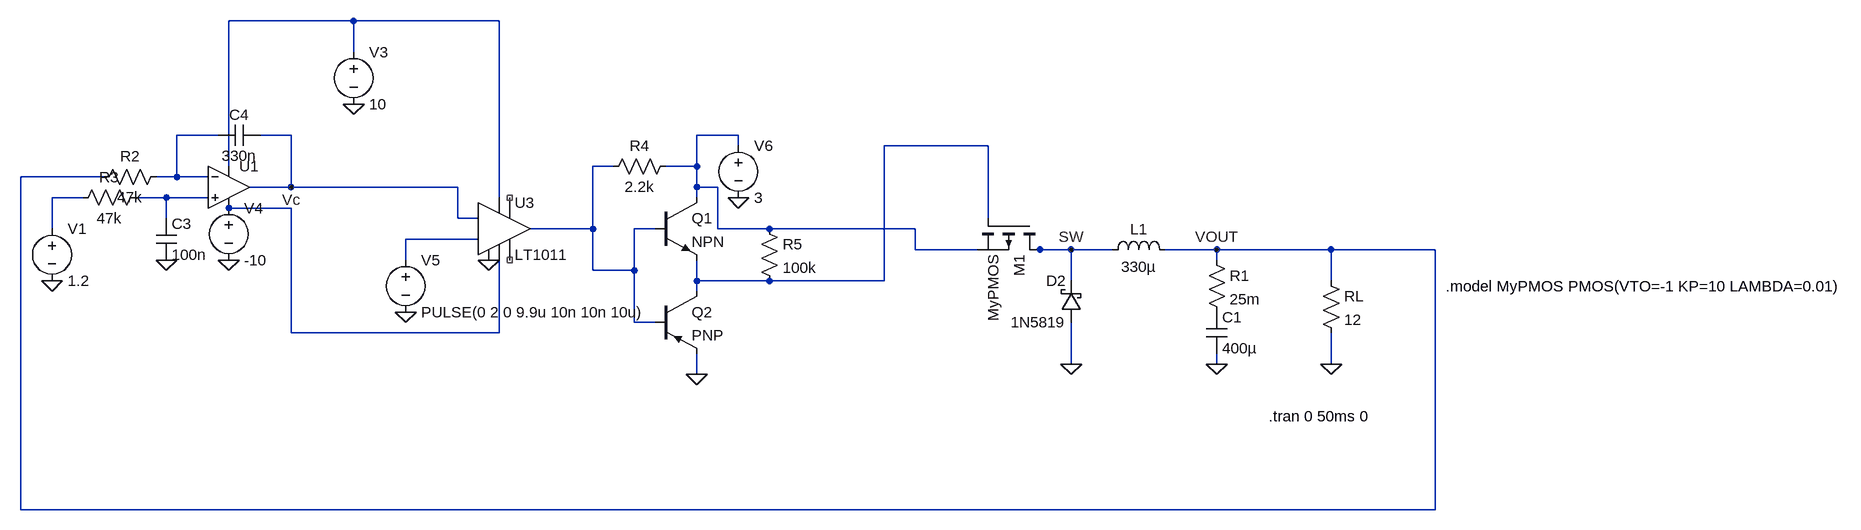
[diagram p0: schematic finalproj.asc]
finalproj.asc, the LTspice schematic file:
Version 4
SHEET 1 1500 680
WIRE -816 -288 -1008 -288
WIRE -592 -288 -816 -288
WIRE -816 -240 -816 -288
WIRE -1024 -112 -1088 -112
WIRE -912 -112 -960 -112
WIRE -224 -112 -288 -112
WIRE -224 -96 -224 -112
WIRE 160 -96 0 -96
WIRE -1008 -64 -1008 -288
WIRE -416 -64 -448 -64
WIRE -288 -64 -288 -112
WIRE -288 -64 -336 -64
WIRE -1200 -48 -1328 -48
WIRE -1088 -48 -1088 -112
WIRE -1088 -48 -1120 -48
WIRE -1040 -48 -1088 -48
WIRE -912 -32 -912 -112
WIRE -912 -32 -976 -32
WIRE -656 -32 -912 -32
WIRE -288 -32 -288 -64
WIRE -256 -32 -288 -32
WIRE -1232 -16 -1280 -16
WIRE -1104 -16 -1152 -16
WIRE -1040 -16 -1104 -16
WIRE -592 -16 -592 -288
WIRE -288 -16 -288 -32
WIRE -912 0 -1008 0
WIRE -1104 16 -1104 -16
WIRE -656 16 -656 -32
WIRE -624 16 -656 16
WIRE 160 16 160 -96
WIRE -1280 32 -1280 -16
WIRE -448 32 -448 -64
WIRE -448 32 -544 32
WIRE -352 32 -384 32
WIRE -256 32 -256 -32
WIRE -176 32 -256 32
WIRE 48 32 -176 32
WIRE -624 48 -736 48
WIRE 48 64 48 32
WIRE 144 64 48 64
WIRE 240 64 224 64
WIRE 288 64 240 64
WIRE 352 64 288 64
WIRE 512 64 432 64
WIRE 688 64 512 64
WIRE 848 64 688 64
WIRE -736 80 -736 48
WIRE 512 80 512 64
WIRE -448 96 -448 32
WIRE -384 96 -384 32
WIRE -384 96 -448 96
WIRE -288 112 -288 80
WIRE -176 112 -288 112
WIRE 0 112 0 -96
WIRE 0 112 -176 112
WIRE 288 112 288 64
WIRE 688 112 688 64
WIRE -288 128 -288 112
WIRE -384 176 -384 96
WIRE -352 176 -384 176
WIRE -912 192 -912 0
WIRE -592 192 -592 80
WIRE -592 192 -912 192
WIRE 288 240 288 176
WIRE 512 240 512 224
WIRE 688 240 688 192
WIRE -288 256 -288 224
WIRE -1328 464 -1328 -48
WIRE 848 464 848 64
WIRE 848 464 -1328 464
FLAG 288 64 SW
FLAG 512 64 VOUT
FLAG 288 240 0
FLAG 512 240 0
FLAG 688 240 0
FLAG -1104 80 0
FLAG -1280 112 0
FLAG -816 -160 0
FLAG -1008 80 0
FLAG -912 -32 Vc
FLAG -736 160 0
FLAG -608 80 0
FLAG -224 -16 0
FLAG -288 256 0
SYMBOL pmos 240 16 R90
SYMATTR InstName M1
SYMATTR Value MyPMOS
SYMBOL ind 336 80 R270
WINDOW 0 32 56 VTop 2
WINDOW 3 5 56 VBottom 2
SYMATTR InstName L1
SYMATTR Value 330µ
SYMATTR SpiceLine Rser=1m
SYMBOL res 496 64 R0
SYMATTR InstName R1
SYMATTR Value 25m
SYMBOL cap 496 160 R0
SYMATTR InstName C1
SYMATTR Value 400µ
SYMBOL res 672 96 R0
SYMATTR InstName RL
SYMATTR Value 12
SYMBOL schottky 304 176 R180
WINDOW 0 24 64 Left 2
WINDOW 3 24 0 Left 2
SYMATTR InstName D2
SYMATTR Value 1N5819
SYMATTR Description Diode
SYMATTR Type diode
SYMBOL res -1104 -64 R90
WINDOW 0 0 56 VBottom 2
WINDOW 3 32 56 VTop 2
SYMATTR InstName R2
SYMATTR Value 47k
SYMBOL UniversalOpAmp -1008 -32 R0
SYMATTR InstName U1
SYMBOL cap -1120 16 R0
SYMATTR InstName C3
SYMATTR Value 100n
SYMBOL res -1136 -32 R90
WINDOW 0 0 56 VBottom 2
WINDOW 3 32 56 VTop 2
SYMATTR InstName R3
SYMATTR Value 47k
SYMBOL voltage -1280 16 R0
SYMATTR InstName V1
SYMATTR Value 1.2
SYMBOL cap -960 -128 R90
WINDOW 0 0 32 VBottom 2
WINDOW 3 32 32 VTop 2
SYMATTR InstName C4
SYMATTR Value 330n
SYMBOL voltage -816 -256 R0
WINDOW 123 0 0 Left 0
WINDOW 39 0 0 Left 0
SYMATTR InstName V3
SYMATTR Value 10
SYMBOL voltage -1008 -16 R0
SYMATTR InstName V4
SYMATTR Value -10
SYMBOL Comparators/LT1011 -592 32 R0
SYMATTR InstName U3
SYMBOL Voltage -736 64 R0
SYMATTR InstName V5
SYMATTR Value PULSE(0 2 0 9.9u 10n 10n 10u)
SYMBOL Res -320 -80 R90
WINDOW 0 0 56 VBottom 2
WINDOW 3 32 56 VTop 2
SYMATTR InstName R4
SYMATTR Value 2.2k
SYMBOL Voltage -224 -112 R0
SYMATTR InstName V6
SYMATTR Value 3
SYMBOL npn -352 -16 R0
SYMATTR InstName Q1
SYMBOL pnp -352 128 R0
SYMATTR InstName Q2
SYMBOL Res -192 16 R0
SYMATTR InstName R5
SYMATTR Value 100k
TEXT 592 320 Left 2 !.tran 0 50ms 0
TEXT 864 120 Left 2 !.model MyPMOS PMOS(VTO=-1 KP=10 LAMBDA=0.01)

The netlist it stands for:
* finalproj.asc
M1 SW N004 N003 N003 MyPMOS
L1 SW VOUT 330µ Rser=1m
R1 VOUT P001 25m
C1 P001 0 400µ
RL VOUT 0 12
D2 0 SW 1N5819
R2 N002 VOUT 47k
XU1 N007 N002 N001 N008 Vc level1 Avol=1Meg GBW=10Meg Vos=0 En=0 Enk=0 In=0 Ink=0 Rin=500Meg  ; pins In+ In- V+ V- OUT
C3 N007 0 100n
R3 N007 N006 47k
V1 N006 0 1.2
C4 Vc N002 330n
V3 N001 0 10
V4 N008 0 -10
XU3 0 N009 Vc N008 NC_01 NC_02 N005 N001 LT1011
V5 N009 0 PULSE(0 2 0 9.9u 10n 10n 10u)
R4 N003 N005 2.2k
V6 N003 0 3
Q1 N003 N005 N004 0 NPN
Q2 N004 N005 0 0 PNP
R5 N003 N004 100k
.model D D
.lib standard.dio
.model NPN NPN
.model PNP PNP
.lib standard.bjt
.model NMOS NMOS
.model PMOS PMOS
.lib standard.mos
.tran 0 50ms 0
.model MyPMOS PMOS(VTO=-1 KP=10 LAMBDA=0.01)
.lib UniversalOpAmp1.lib
.lib LTC1.lib
.backanno
.end